# Altium schematic sheet logic_power_mux.SchDoc
size A4; SheetNumber: 2; SheetTotal: 5
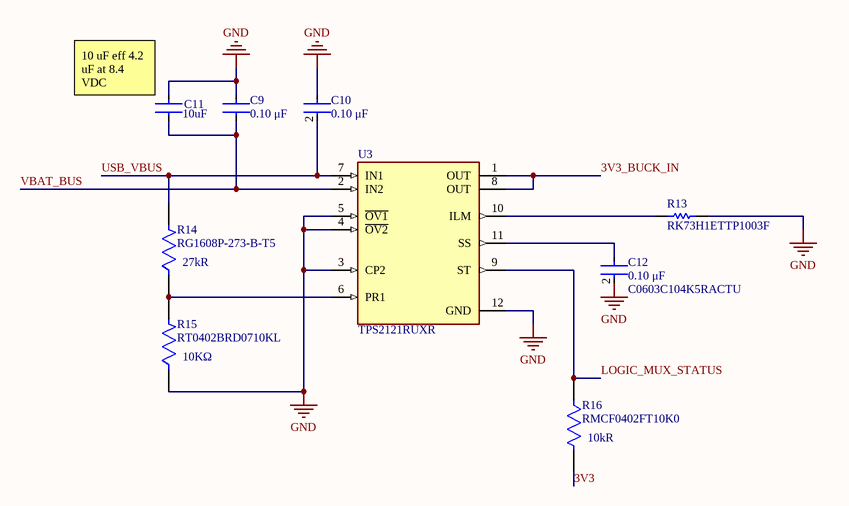
[diagram p0: logic_power_mux.SchDoc]

## Parts
C9  Capacitance: 0.10 μF  [FP-C0603C-CF-MFG]  (hidden comment: C0603C104K5RACTU)
C10  Capacitance: 0.10 μF  [FP-C0603C-CF-MFG]  (hidden comment: C0603C104K5RACTU)
C11  Capacitance: 10uF  [FP-GRM21B-0_2-e0_2_0_7-IPC_A]  (hidden comment: GRM21BR61H106KE43L)
C12  C0603C104K5RACTU  Capacitance: 0.10 μF  [FP-C0603C-CF-MFG]
R13  RK73H1ETTP1003F  [RESC1005X40X25NL10T10]
R14  RG1608P-273-B-T5  Resistance: 27kR  [FP-RG1608-MFG]
R15  RT0402BRD0710KL  value 10KΩ  [FP-RT0402-MFG]
R16  RMCF0402FT10K0  Resistance: 10kR  [FP-RMCF0402-IPC_C]
U3  TPS2121RUXR  [FP-RUX0012A-MFG]

## Nets
GND: C9.1 C10.1 C11.1 C12.2 R13.1 R15.1 U3.3(CP2) U3.4(~{OV2}) U3.5(~{OV1}) U3.12(GND)
3V3: R16.2
3V3_BUCK_IN: U3.1(OUT) U3.8(OUT)
LOGIC_MUX_STATUS: R16.1 U3.9(ST)
USB_VBUS: C10.2 R14.2 U3.7(IN1)
VBAT_BUS: C9.2 C11.2 U3.2(IN2)
NetC12_1: C12.1 U3.11(SS)
NetR13_2: R13.2 U3.10(ILM)
NetR14_1: R14.1 R15.2 U3.6(PR1)

## Notes on the sheet
- (near C11) 10 uF eff 4.2 uF at 8.4 VDC

## Library data of the parts
C9 C10 C12 = CMP-2006-03061-2: CAP CER 0.1UF 50V X7R 0603; Manufacturer: KEMET; Tolerance: 0.1; Temperature Coefficient: 30ppm/°C; Material: Ceramic; Automotive Grade: Grade 1; Value: 0.10 μF; Description: C0603 0.10 μF X7R 30ppm/°C 10.00% 50 V; Temperature: -55°C to +125°C; RoHS: TRUE; Temperature Range High: +125°C; Lead Free: Yes; Octopart: https://octopart.com/c0603c104k5ractu-kemet-139244; Digikey Description: CAP CER 0.1UF 50V X7R 0603; Category: Cap; Package: C0603C-CF; ComponentLink2Description: Datasheet; Temperature Range Low: -55°C; Device Class L1: Passive Components; Voltage Rating: 50 V; Automotive: Yes; Device Class L3: Ceramic Capacitors; ComponentLink2URL: https://api.kemet.com/component-edge/download/datasheet/C0603C100J5GACAUTO.pdf; Device Class L2: Capacitors; Manufacturer Part Number: C0603C104K5RACTU; Temperature Characteristic: X7R; Height: 0.87mm
C11 = CMP-06035-004402-1: Chip Multilayer Ceramic Capacitors for General Purpose, 0805, 10uF, X5R, 15%, 10%, 50V; Voltage Rating (DC): 50V; Dielectric: X5R; Tolerance: 10%; Thickness: 1.25mm; Length: 2mm; Width: 1.25mm
R13 = CMP-2002-04173-1: Manufacturer: KOA Speer; Part Number: RK73H1ETTP1003F
R14 = CMP-2000-02157-2: Automotive Metal Thin Film Chip Resistor, 0603, 27kΩ, 0.1%, 25ppm/°C, 0.1W, 100V; Power Rating: 100mW; Voltage Rating (DC): 75V; Temperature Coefficient: 25ppm/°C; Construction: Rectangular; Max Operating Temperature: 155°C; Number of Terminations: 2; Lead Free: Lead Free; Length: 1.6mm; Series: RG; Case/Package: 0603; Military Standard: Not; Weight: 7.1E-05oz; Case Code (Metric): 1608; Packaging: Tape and Reel; Package Quantity: 1; Resistor Type: Thin Film; Height: 0.02inch; Features: Automotive AEC-Q200; Voltage Rating: 100V; Min Operating Temperature: -55°C; Max Power Dissipation: 100mW; Case Code (Imperial): 0603; Width: 0.031inch; Termination: SMD/SMT; Tolerance: 0.1%; Size Code: 0603; Depth: 0.8mm; RoHS Compliant: Yes
R15 = CMP-2002-02915-2: RES 10.0K OHM 1/16W .1% SMD 0402; Manufacturer: Yageo; Voltage Rating: 50V; Power Rating: 0.063W; Temperature Coefficient: 25 ppm/°C; Tolerance: 0.001; Description: RT0402 10KΩ 0.063W 25 ppm/°C 0.10%; Height: 0.35mm; Ipc Land Pattern Name: RESC10050X30; Device Class L1: Passive Components; Mouser Description: Thin Film Resistors - SMD 10K ohm 0.1% 1/16W; ComponentLink2URL: http://www.yageo.com/documents/recent/PYu-RT_1-to-0.01_RoHS_L_9.pdf; Automotive: No; Series: RT; Package: RT0402; ComponentLink2Description: Datasheet; Footprint Url: http://www.yageo.com/exep/pages/download/literatures/PYu-R_Mount_10.pdf; Digikey Description: RES 10.0K OHM 1/16W .1% SMD 0402; Resistance: 10KΩ; Temperature Range High: +155°C; Device Class L3: Chip SMD Resistors; Manufacturer Part Number: RT0402BRD0710KL; Lead Free: Yes; Category: Res; Device Class L2: Resistors; RoHS: TRUE; Temperature Range Low: -55°C; Composition: Thin Film; Temperature: -55°C to +155°C; Octopart: https://octopart.com/rt0402brd0710kl-yageo-1181432
R16 = CMP-26527-000128-1: 10kΩ ±1% 0.063W 0402 Thick Film Chip Resistor AEC-Q200 compliant; Temperature Coefficient: 100ppm/°C; Power Rating: 62.5mW; Max Power Dissipation: 63mW; Width: 0.02inch; Case/Package: 0402; Depth: 0.5mm; Resistor Type: Thick Film; Series: RMCF; Length: 1mm; Contact Plating: Tin; Tolerance: 1%; Number of Terminations: 2; Height: 0.016inch; Military Standard: Not; Case Code (Imperial): 0402; Size Code: 0402; Construction: Rectangular; Radiation Hardening: No; RoHS Compliant: Yes; Case Code (Metric): 1005; Packaging: Tape and Reel; Lead Free: Lead Free; Min Operating Temperature: -55°C; Max Operating Temperature: 155°C; Mount: Surface Mount; Features: Automotive AEC-Q200
U3 = CMP-04910-000009-1: PWR MGMT BATTERY MGMT; Manufacturer: Texas Instruments; Min Supply Voltage: 2.8V; Max Junction Temp: +125°C; Output Voltage: 22V; Output Current: 1.5-5.2A; Standoff Height: 0mm; Number Of Outputs: 1; Nominal Supply Current: 300uA; Device Class L2: Power Management ICs; Octopart: https://octopart.com/tps2121ruxr-texas+instruments-95511053; Mouser Description: 2.7-22V, 56m?, 4.5A, Priority Power MUX with Seamless Switchover 12-VQFN-HR -40 to 125; Lead Free: Yes; Digikey Description: PWR MGMT BATTERY MGMT; Manufacturer Part Number: TPS2121RUXR; Height: 1mm; Device Class L1: Integrated Circuits (ICs); Category: IC; Max Supply Voltage: 22V; ComponentLink2Description: Datasheet; Temperature: -40°C to +125°C; Temperature Range High: +125°C; ComponentLink2URL: https://www.ti.com/lit/ds/symlink/tps2121.pdf; Automotive: No; Package: RUX0012A; RoHS: TRUE; Device Class L3: unset; Temperature Range Low: -40°C